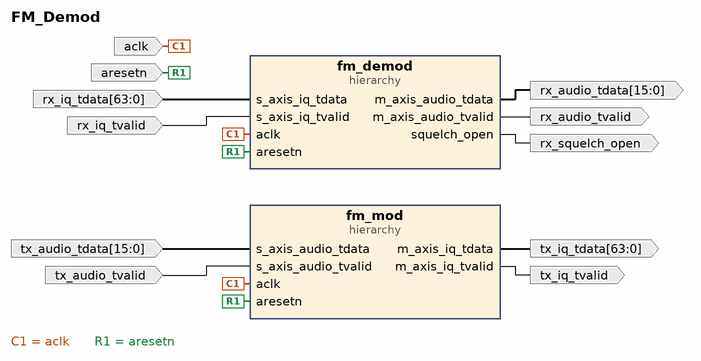
[diagram p0: block diagram of the top level]
# Vivado block design FM_Demod, xc7k410tlfbg900-2L, Vivado 2019.1
create_bd_design FM_Demod

create_bd_port -dir I -type clk aclk
set_property -dict {CONFIG.ASSOCIATED_RESET aresetn CONFIG.FREQ_HZ 100000000} [get_bd_ports aclk]
create_bd_port -dir I -type rst aresetn
set_property -dict {CONFIG.POLARITY ACTIVE_LOW} [get_bd_ports aresetn]
create_bd_port -dir I -from 63 -to 0 rx_iq_tdata
create_bd_port -dir I rx_iq_tvalid
create_bd_port -dir O -from 15 -to 0 rx_audio_tdata
create_bd_port -dir O rx_audio_tvalid
create_bd_port -dir O rx_squelch_open
create_bd_port -dir I -from 15 -to 0 tx_audio_tdata
create_bd_port -dir I tx_audio_tvalid
create_bd_port -dir O -from 63 -to 0 tx_iq_tdata
create_bd_port -dir O tx_iq_tvalid

create_bd_cell -type hier fm_demod
create_bd_cell -type hier fm_mod

# ---- hierarchy /fm_demod ----
current_bd_instance /fm_demod
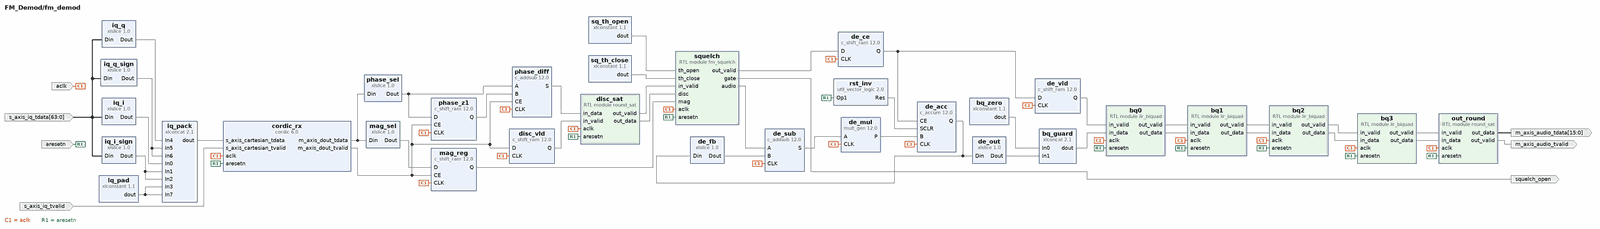
[diagram p1: block diagram inside /fm_demod, whole]
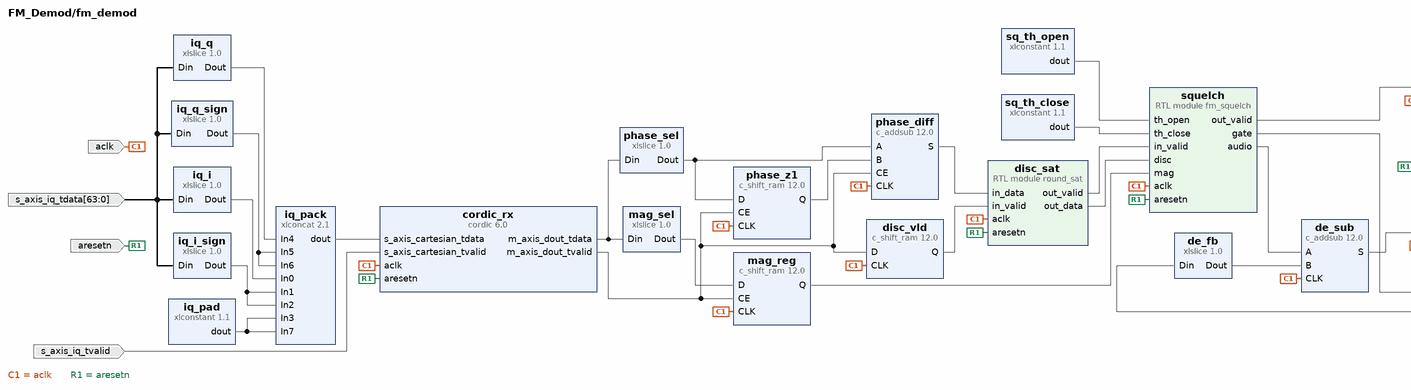
[diagram p2: block diagram inside /fm_demod, left part]
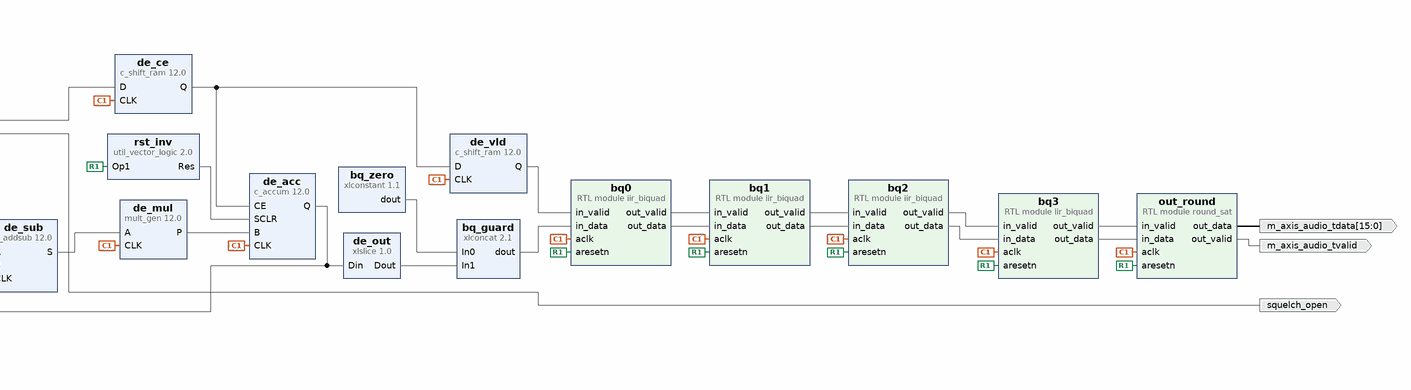
[diagram p3: block diagram inside /fm_demod, right part]
create_bd_pin -dir I -type clk aclk
create_bd_pin -dir I -type rst aresetn
create_bd_pin -dir I -from 63 -to 0 s_axis_iq_tdata
create_bd_pin -dir I s_axis_iq_tvalid
create_bd_pin -dir O -from 15 -to 0 m_axis_audio_tdata
create_bd_pin -dir O m_axis_audio_tvalid
create_bd_pin -dir O squelch_open

create_bd_cell -type ip -vlnv xilinx.com:ip:util_vector_logic:2.0 rst_inv
set_property -dict {CONFIG.C_OPERATION not CONFIG.C_SIZE 1} [get_bd_cells rst_inv]
create_bd_cell -type ip -vlnv xilinx.com:ip:xlslice:1.0 iq_i
set_property -dict {CONFIG.DIN_FROM 31 CONFIG.DIN_TO 0 CONFIG.DIN_WIDTH 64 CONFIG.DOUT_WIDTH 32} [get_bd_cells iq_i]
create_bd_cell -type ip -vlnv xilinx.com:ip:xlslice:1.0 iq_i_sign
set_property -dict {CONFIG.DIN_FROM 31 CONFIG.DIN_TO 31 CONFIG.DIN_WIDTH 64 CONFIG.DOUT_WIDTH 1} [get_bd_cells iq_i_sign]
create_bd_cell -type ip -vlnv xilinx.com:ip:xlslice:1.0 iq_q
set_property -dict {CONFIG.DIN_FROM 63 CONFIG.DIN_TO 32 CONFIG.DIN_WIDTH 64 CONFIG.DOUT_WIDTH 32} [get_bd_cells iq_q]
create_bd_cell -type ip -vlnv xilinx.com:ip:xlslice:1.0 iq_q_sign
set_property -dict {CONFIG.DIN_FROM 63 CONFIG.DIN_TO 63 CONFIG.DIN_WIDTH 64 CONFIG.DOUT_WIDTH 1} [get_bd_cells iq_q_sign]
create_bd_cell -type ip -vlnv xilinx.com:ip:xlconstant:1.1 iq_pad
set_property -dict {CONFIG.CONST_VAL 0 CONFIG.CONST_WIDTH 6} [get_bd_cells iq_pad]
create_bd_cell -type ip -vlnv xilinx.com:ip:xlconcat:2.1 iq_pack
set_property -dict [list \
  CONFIG.IN0_WIDTH 32 \
  CONFIG.IN1_WIDTH 1 \
  CONFIG.IN2_WIDTH 1 \
  CONFIG.IN3_WIDTH 6 \
  CONFIG.IN4_WIDTH 32 \
  CONFIG.IN5_WIDTH 1 \
  CONFIG.IN6_WIDTH 1 \
  CONFIG.IN7_WIDTH 6 \
  CONFIG.NUM_PORTS 8 \
] [get_bd_cells iq_pack]
create_bd_cell -type ip -vlnv xilinx.com:ip:cordic:6.0 cordic_rx
set_property -dict [list \
  CONFIG.ARESETN true \
  CONFIG.Architectural_Configuration Word_Serial \
  CONFIG.Coarse_Rotation true \
  CONFIG.Compensation_Scaling No_Scale_Compensation \
  CONFIG.Data_Format SignedFraction \
  CONFIG.Functional_Selection Translate \
  CONFIG.Input_Width 34 \
  CONFIG.Iterations 0 \
  CONFIG.Output_Width 38 \
  CONFIG.Phase_Format Scaled_Radians \
  CONFIG.Pipelining_Mode Maximum \
  CONFIG.Precision 0 \
  CONFIG.Round_Mode Truncate \
  CONFIG.flow_control NonBlocking \
] [get_bd_cells cordic_rx]
create_bd_cell -type ip -vlnv xilinx.com:ip:xlslice:1.0 mag_sel
set_property -dict {CONFIG.DIN_FROM 37 CONFIG.DIN_TO 4 CONFIG.DIN_WIDTH 80 CONFIG.DOUT_WIDTH 34} [get_bd_cells mag_sel]
create_bd_cell -type ip -vlnv xilinx.com:ip:xlslice:1.0 phase_sel
set_property -dict {CONFIG.DIN_FROM 75 CONFIG.DIN_TO 56 CONFIG.DIN_WIDTH 80 CONFIG.DOUT_WIDTH 20} [get_bd_cells phase_sel]
create_bd_cell -type ip -vlnv xilinx.com:ip:c_shift_ram:12.0 phase_z1
set_property -dict {CONFIG.CE true CONFIG.Depth 1 CONFIG.Width 20} [get_bd_cells phase_z1]
create_bd_cell -type ip -vlnv xilinx.com:ip:c_shift_ram:12.0 mag_reg
set_property -dict {CONFIG.CE true CONFIG.Depth 1 CONFIG.Width 34} [get_bd_cells mag_reg]
create_bd_cell -type ip -vlnv xilinx.com:ip:c_addsub:12.0 phase_diff
set_property -dict [list \
  CONFIG.A_Width 20 \
  CONFIG.Add_Mode Subtract \
  CONFIG.B_Width 20 \
  CONFIG.CE true \
  CONFIG.Latency 1 \
  CONFIG.Out_Width 20 \
] [get_bd_cells phase_diff]
create_bd_cell -type ip -vlnv xilinx.com:ip:c_shift_ram:12.0 disc_vld
set_property -dict {CONFIG.CE false CONFIG.Depth 1 CONFIG.Width 1} [get_bd_cells disc_vld]
create_bd_cell -type module -reference round_sat disc_sat
set_property -dict {CONFIG.IN_W 20 CONFIG.LIMIT 0 CONFIG.OUT_W 16 CONFIG.ROUND 0 CONFIG.SHIFT 2} [get_bd_cells disc_sat]
create_bd_cell -type module -reference fm_squelch squelch
set_property -dict {CONFIG.AUDIO_W 16 CONFIG.AVG_LOG2 8 CONFIG.MAG_W 34} [get_bd_cells squelch]
create_bd_cell -type ip -vlnv xilinx.com:ip:xlconstant:1.1 sq_th_open
set_property -dict {CONFIG.CONST_VAL 312575733 CONFIG.CONST_WIDTH 34} [get_bd_cells sq_th_open]
create_bd_cell -type ip -vlnv xilinx.com:ip:xlconstant:1.1 sq_th_close
set_property -dict {CONFIG.CONST_VAL 156287866 CONFIG.CONST_WIDTH 34} [get_bd_cells sq_th_close]
create_bd_cell -type ip -vlnv xilinx.com:ip:c_addsub:12.0 de_sub
set_property -dict [list \
  CONFIG.A_Width 16 \
  CONFIG.Add_Mode Subtract \
  CONFIG.B_Width 16 \
  CONFIG.CE false \
  CONFIG.Latency 1 \
  CONFIG.Out_Width 17 \
] [get_bd_cells de_sub]
create_bd_cell -type ip -vlnv xilinx.com:ip:mult_gen:12.0 de_mul
set_property -dict [list \
  CONFIG.ConstValue 1795 \
  CONFIG.MultType Constant_Coefficient_Multiplier \
  CONFIG.PipeStages 1 \
  CONFIG.PortAType Signed \
  CONFIG.PortAWidth 17 \
] [get_bd_cells de_mul]
create_bd_cell -type ip -vlnv xilinx.com:ip:c_accum:12.0 de_acc
set_property -dict [list \
  CONFIG.Accum_Mode Add \
  CONFIG.Bypass false \
  CONFIG.CE true \
  CONFIG.Input_Type Signed \
  CONFIG.Input_Width 28 \
  CONFIG.Latency 1 \
  CONFIG.Output_Width 32 \
  CONFIG.SCLR true \
] [get_bd_cells de_acc]
create_bd_cell -type ip -vlnv xilinx.com:ip:xlslice:1.0 de_fb
set_property -dict {CONFIG.DIN_FROM 31 CONFIG.DIN_TO 16 CONFIG.DIN_WIDTH 32 CONFIG.DOUT_WIDTH 16} [get_bd_cells de_fb]
create_bd_cell -type ip -vlnv xilinx.com:ip:xlslice:1.0 de_out
set_property -dict {CONFIG.DIN_FROM 31 CONFIG.DIN_TO 14 CONFIG.DIN_WIDTH 32 CONFIG.DOUT_WIDTH 18} [get_bd_cells de_out]
create_bd_cell -type ip -vlnv xilinx.com:ip:c_shift_ram:12.0 de_ce
set_property -dict {CONFIG.CE false CONFIG.Depth 4 CONFIG.Width 1} [get_bd_cells de_ce]
create_bd_cell -type ip -vlnv xilinx.com:ip:c_shift_ram:12.0 de_vld
set_property -dict {CONFIG.CE false CONFIG.Depth 1 CONFIG.Width 1} [get_bd_cells de_vld]
create_bd_cell -type ip -vlnv xilinx.com:ip:xlconstant:1.1 bq_zero
set_property -dict {CONFIG.CONST_VAL 0 CONFIG.CONST_WIDTH 8} [get_bd_cells bq_zero]
create_bd_cell -type ip -vlnv xilinx.com:ip:xlconcat:2.1 bq_guard
set_property -dict {CONFIG.IN0_WIDTH 8 CONFIG.IN1_WIDTH 18 CONFIG.NUM_PORTS 2} [get_bd_cells bq_guard]
create_bd_cell -type module -reference iir_biquad bq0
set_property -dict [list \
  CONFIG.A1 -126387 \
  CONFIG.A2 60948 \
  CONFIG.B0 63218 \
  CONFIG.B1 -126436 \
  CONFIG.B2 63218 \
  CONFIG.COEF_W 18 \
  CONFIG.DATA_W 26 \
  CONFIG.FRAC 16 \
] [get_bd_cells bq0]
create_bd_cell -type module -reference iir_biquad bq1
set_property -dict [list \
  CONFIG.A1 -129032 \
  CONFIG.A2 63596 \
  CONFIG.B0 64541 \
  CONFIG.B1 -129082 \
  CONFIG.B2 64541 \
  CONFIG.COEF_W 18 \
  CONFIG.DATA_W 26 \
  CONFIG.FRAC 16 \
] [get_bd_cells bq1]
create_bd_cell -type module -reference iir_biquad bq2
set_property -dict [list \
  CONFIG.A1 -89464 \
  CONFIG.A2 31299 \
  CONFIG.B0 1843 \
  CONFIG.B1 3686 \
  CONFIG.B2 1843 \
  CONFIG.COEF_W 18 \
  CONFIG.DATA_W 26 \
  CONFIG.FRAC 16 \
] [get_bd_cells bq2]
create_bd_cell -type module -reference iir_biquad bq3
set_property -dict [list \
  CONFIG.A1 -105626 \
  CONFIG.A2 48793 \
  CONFIG.B0 2176 \
  CONFIG.B1 4352 \
  CONFIG.B2 2176 \
  CONFIG.COEF_W 18 \
  CONFIG.DATA_W 26 \
  CONFIG.FRAC 16 \
] [get_bd_cells bq3]
create_bd_cell -type module -reference round_sat out_round
set_property -dict {CONFIG.IN_W 26 CONFIG.LIMIT 0 CONFIG.OUT_W 16 CONFIG.ROUND 1 CONFIG.SHIFT 8} [get_bd_cells out_round]

# ---- hierarchy /fm_mod ----
current_bd_instance /fm_mod
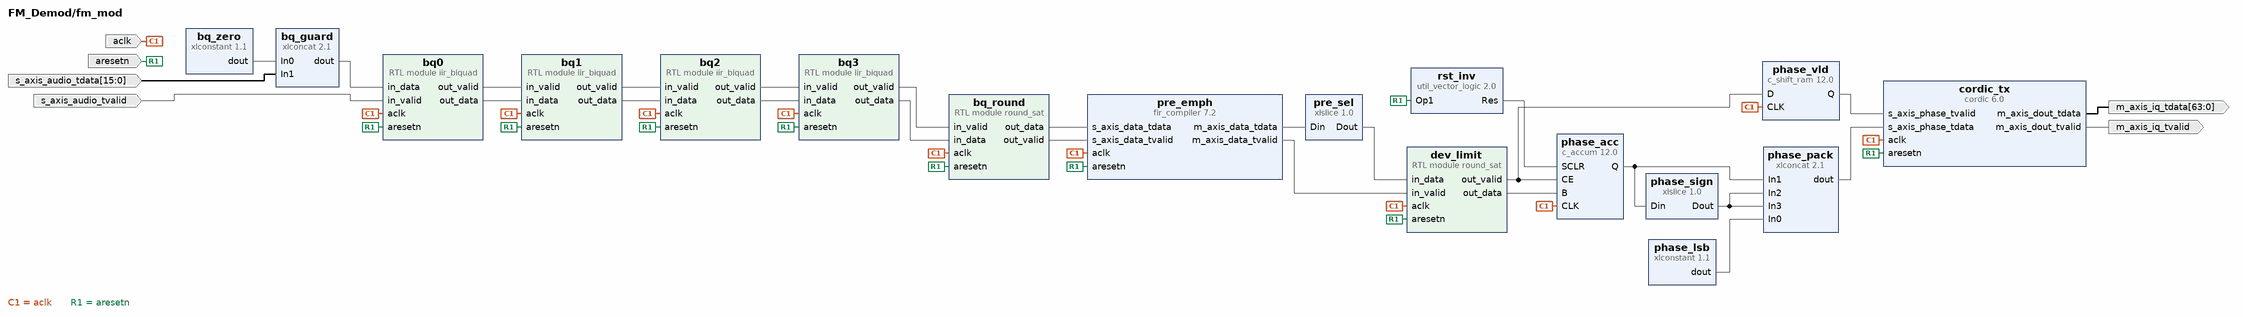
[diagram p4: block diagram inside /fm_mod]
create_bd_pin -dir I -type clk aclk
create_bd_pin -dir I -type rst aresetn
create_bd_pin -dir I -from 15 -to 0 s_axis_audio_tdata
create_bd_pin -dir I s_axis_audio_tvalid
create_bd_pin -dir O -from 63 -to 0 m_axis_iq_tdata
create_bd_pin -dir O m_axis_iq_tvalid

create_bd_cell -type ip -vlnv xilinx.com:ip:util_vector_logic:2.0 rst_inv
set_property -dict {CONFIG.C_OPERATION not CONFIG.C_SIZE 1} [get_bd_cells rst_inv]
create_bd_cell -type ip -vlnv xilinx.com:ip:xlconstant:1.1 bq_zero
set_property -dict {CONFIG.CONST_VAL 0 CONFIG.CONST_WIDTH 8} [get_bd_cells bq_zero]
create_bd_cell -type ip -vlnv xilinx.com:ip:xlconcat:2.1 bq_guard
set_property -dict {CONFIG.IN0_WIDTH 8 CONFIG.IN1_WIDTH 16 CONFIG.NUM_PORTS 2} [get_bd_cells bq_guard]
create_bd_cell -type module -reference iir_biquad bq0
set_property -dict [list \
  CONFIG.A1 -126387 \
  CONFIG.A2 60948 \
  CONFIG.B0 63218 \
  CONFIG.B1 -126436 \
  CONFIG.B2 63218 \
  CONFIG.COEF_W 18 \
  CONFIG.DATA_W 24 \
  CONFIG.FRAC 16 \
] [get_bd_cells bq0]
create_bd_cell -type module -reference iir_biquad bq1
set_property -dict [list \
  CONFIG.A1 -129032 \
  CONFIG.A2 63596 \
  CONFIG.B0 64541 \
  CONFIG.B1 -129082 \
  CONFIG.B2 64541 \
  CONFIG.COEF_W 18 \
  CONFIG.DATA_W 24 \
  CONFIG.FRAC 16 \
] [get_bd_cells bq1]
create_bd_cell -type module -reference iir_biquad bq2
set_property -dict [list \
  CONFIG.A1 -89464 \
  CONFIG.A2 31299 \
  CONFIG.B0 1843 \
  CONFIG.B1 3686 \
  CONFIG.B2 1843 \
  CONFIG.COEF_W 18 \
  CONFIG.DATA_W 24 \
  CONFIG.FRAC 16 \
] [get_bd_cells bq2]
create_bd_cell -type module -reference iir_biquad bq3
set_property -dict [list \
  CONFIG.A1 -105626 \
  CONFIG.A2 48793 \
  CONFIG.B0 2176 \
  CONFIG.B1 4352 \
  CONFIG.B2 2176 \
  CONFIG.COEF_W 18 \
  CONFIG.DATA_W 24 \
  CONFIG.FRAC 16 \
] [get_bd_cells bq3]
create_bd_cell -type module -reference round_sat bq_round
set_property -dict {CONFIG.IN_W 24 CONFIG.LIMIT 0 CONFIG.OUT_W 16 CONFIG.ROUND 1 CONFIG.SHIFT 8} [get_bd_cells bq_round]
create_bd_cell -type ip -vlnv xilinx.com:ip:fir_compiler:7.2 pre_emph
set_property -dict [list \
  CONFIG.Clock_Frequency 100.0 \
  CONFIG.CoefficientSource Vector \
  CONFIG.CoefficientVector 9347,-9091 \
  CONFIG.Coefficient_Fractional_Bits 0 \
  CONFIG.Coefficient_Sign Signed \
  CONFIG.Coefficient_Structure Non_Symmetric \
  CONFIG.Coefficient_Width 15 \
  CONFIG.Data_Fractional_Bits 0 \
  CONFIG.Data_Sign Signed \
  CONFIG.Data_Width 16 \
  CONFIG.Filter_Architecture Systolic_Multiply_Accumulate \
  CONFIG.Filter_Type Single_Rate \
  CONFIG.Has_ARESETn true \
  CONFIG.Output_Rounding_Mode Full_Precision \
  CONFIG.Quantization Integer_Coefficients \
  CONFIG.RateSpecification Frequency_Specification \
  CONFIG.S_DATA_Has_FIFO false \
  CONFIG.Sample_Frequency 0.048 \
] [get_bd_cells pre_emph]
create_bd_cell -type ip -vlnv xilinx.com:ip:xlslice:1.0 pre_sel
set_property -dict {CONFIG.DIN_FROM 30 CONFIG.DIN_TO 0 CONFIG.DIN_WIDTH 32 CONFIG.DOUT_WIDTH 31} [get_bd_cells pre_sel]
create_bd_cell -type module -reference round_sat dev_limit
set_property -dict {CONFIG.IN_W 31 CONFIG.LIMIT 13981013 CONFIG.OUT_W 25 CONFIG.ROUND 0 CONFIG.SHIFT 0} [get_bd_cells dev_limit]
create_bd_cell -type ip -vlnv xilinx.com:ip:c_accum:12.0 phase_acc
set_property -dict [list \
  CONFIG.Accum_Mode Add \
  CONFIG.Bypass false \
  CONFIG.CE true \
  CONFIG.Input_Type Signed \
  CONFIG.Input_Width 25 \
  CONFIG.Latency 1 \
  CONFIG.Output_Width 28 \
  CONFIG.SCLR true \
] [get_bd_cells phase_acc]
create_bd_cell -type ip -vlnv xilinx.com:ip:c_shift_ram:12.0 phase_vld
set_property -dict {CONFIG.CE false CONFIG.Depth 1 CONFIG.Width 1} [get_bd_cells phase_vld]
create_bd_cell -type ip -vlnv xilinx.com:ip:xlslice:1.0 phase_sign
set_property -dict {CONFIG.DIN_FROM 27 CONFIG.DIN_TO 27 CONFIG.DIN_WIDTH 28 CONFIG.DOUT_WIDTH 1} [get_bd_cells phase_sign]
create_bd_cell -type ip -vlnv xilinx.com:ip:xlconstant:1.1 phase_lsb
set_property -dict {CONFIG.CONST_VAL 0 CONFIG.CONST_WIDTH 2} [get_bd_cells phase_lsb]
create_bd_cell -type ip -vlnv xilinx.com:ip:xlconcat:2.1 phase_pack
set_property -dict [list \
  CONFIG.IN0_WIDTH 2 \
  CONFIG.IN1_WIDTH 28 \
  CONFIG.IN2_WIDTH 1 \
  CONFIG.IN3_WIDTH 1 \
  CONFIG.NUM_PORTS 4 \
] [get_bd_cells phase_pack]
create_bd_cell -type ip -vlnv xilinx.com:ip:cordic:6.0 cordic_tx
set_property -dict [list \
  CONFIG.ARESETN true \
  CONFIG.Architectural_Configuration Word_Serial \
  CONFIG.Coarse_Rotation true \
  CONFIG.Data_Format SignedFraction \
  CONFIG.Functional_Selection Sin_and_Cos \
  CONFIG.Input_Width 32 \
  CONFIG.Iterations 0 \
  CONFIG.Output_Width 32 \
  CONFIG.Phase_Format Scaled_Radians \
  CONFIG.Pipelining_Mode Maximum \
  CONFIG.Precision 0 \
  CONFIG.Round_Mode Nearest_Even \
  CONFIG.flow_control NonBlocking \
] [get_bd_cells cordic_tx]

# ---- connections ----

current_bd_instance /fm_demod
connect_bd_net [get_bd_pins s_axis_iq_tdata] [get_bd_pins iq_i/Din] [get_bd_pins iq_i_sign/Din] [get_bd_pins iq_q/Din] [get_bd_pins iq_q_sign/Din]
connect_bd_net [get_bd_pins iq_i/Dout] [get_bd_pins iq_pack/In0]
connect_bd_net [get_bd_pins iq_i_sign/Dout] [get_bd_pins iq_pack/In1] [get_bd_pins iq_pack/In2]
connect_bd_net [get_bd_pins iq_q/Dout] [get_bd_pins iq_pack/In4]
connect_bd_net [get_bd_pins iq_q_sign/Dout] [get_bd_pins iq_pack/In5] [get_bd_pins iq_pack/In6]
connect_bd_net [get_bd_pins iq_pad/dout] [get_bd_pins iq_pack/In3] [get_bd_pins iq_pack/In7]
connect_bd_net [get_bd_pins iq_pack/dout] [get_bd_pins cordic_rx/s_axis_cartesian_tdata]
connect_bd_net [get_bd_pins s_axis_iq_tvalid] [get_bd_pins cordic_rx/s_axis_cartesian_tvalid]
connect_bd_net [get_bd_pins cordic_rx/m_axis_dout_tdata] [get_bd_pins mag_sel/Din] [get_bd_pins phase_sel/Din]
connect_bd_net [get_bd_pins phase_sel/Dout] [get_bd_pins phase_z1/D] [get_bd_pins phase_diff/A]
connect_bd_net [get_bd_pins phase_z1/Q] [get_bd_pins phase_diff/B]
connect_bd_net [get_bd_pins mag_sel/Dout] [get_bd_pins mag_reg/D]
connect_bd_net [get_bd_pins cordic_rx/m_axis_dout_tvalid] \
  [get_bd_pins phase_z1/CE] [get_bd_pins mag_reg/CE] [get_bd_pins phase_diff/CE] [get_bd_pins disc_vld/D]
connect_bd_net [get_bd_pins phase_diff/S] [get_bd_pins disc_sat/in_data]
connect_bd_net [get_bd_pins disc_vld/Q] [get_bd_pins disc_sat/in_valid]
connect_bd_net [get_bd_pins disc_sat/out_valid] [get_bd_pins squelch/in_valid]
connect_bd_net [get_bd_pins disc_sat/out_data] [get_bd_pins squelch/disc]
connect_bd_net [get_bd_pins mag_reg/Q] [get_bd_pins squelch/mag]
connect_bd_net [get_bd_pins sq_th_open/dout] [get_bd_pins squelch/th_open]
connect_bd_net [get_bd_pins sq_th_close/dout] [get_bd_pins squelch/th_close]
connect_bd_net [get_bd_pins squelch/gate] [get_bd_pins squelch_open]
connect_bd_net [get_bd_pins squelch/audio] [get_bd_pins de_sub/A]
connect_bd_net [get_bd_pins de_fb/Dout] [get_bd_pins de_sub/B]
connect_bd_net [get_bd_pins de_sub/S] [get_bd_pins de_mul/A]
connect_bd_net [get_bd_pins de_mul/P] [get_bd_pins de_acc/B]
connect_bd_net [get_bd_pins de_acc/Q] [get_bd_pins de_fb/Din] [get_bd_pins de_out/Din]
connect_bd_net [get_bd_pins squelch/out_valid] [get_bd_pins de_ce/D]
connect_bd_net [get_bd_pins de_ce/Q] [get_bd_pins de_acc/CE] [get_bd_pins de_vld/D]
connect_bd_net [get_bd_pins bq_zero/dout] [get_bd_pins bq_guard/In0]
connect_bd_net [get_bd_pins de_out/Dout] [get_bd_pins bq_guard/In1]
connect_bd_net [get_bd_pins de_vld/Q] [get_bd_pins bq0/in_valid]
connect_bd_net [get_bd_pins bq_guard/dout] [get_bd_pins bq0/in_data]
connect_bd_net [get_bd_pins bq0/out_valid] [get_bd_pins bq1/in_valid]
connect_bd_net [get_bd_pins bq0/out_data] [get_bd_pins bq1/in_data]
connect_bd_net [get_bd_pins bq1/out_valid] [get_bd_pins bq2/in_valid]
connect_bd_net [get_bd_pins bq1/out_data] [get_bd_pins bq2/in_data]
connect_bd_net [get_bd_pins bq2/out_valid] [get_bd_pins bq3/in_valid]
connect_bd_net [get_bd_pins bq2/out_data] [get_bd_pins bq3/in_data]
connect_bd_net [get_bd_pins bq3/out_valid] [get_bd_pins out_round/in_valid]
connect_bd_net [get_bd_pins bq3/out_data] [get_bd_pins out_round/in_data]
connect_bd_net [get_bd_pins out_round/out_data] [get_bd_pins m_axis_audio_tdata]
connect_bd_net [get_bd_pins out_round/out_valid] [get_bd_pins m_axis_audio_tvalid]
connect_bd_net [get_bd_pins aclk] \
  [get_bd_pins bq0/aclk] [get_bd_pins bq1/aclk] [get_bd_pins bq2/aclk] [get_bd_pins bq3/aclk] [get_bd_pins cordic_rx/aclk] \
  [get_bd_pins de_acc/CLK] [get_bd_pins de_ce/CLK] [get_bd_pins de_mul/CLK] [get_bd_pins de_sub/CLK] [get_bd_pins de_vld/CLK] \
  [get_bd_pins disc_sat/aclk] [get_bd_pins disc_vld/CLK] [get_bd_pins mag_reg/CLK] [get_bd_pins out_round/aclk] \
  [get_bd_pins phase_diff/CLK] [get_bd_pins phase_z1/CLK] [get_bd_pins squelch/aclk]
connect_bd_net [get_bd_pins aresetn] \
  [get_bd_pins bq0/aresetn] [get_bd_pins bq1/aresetn] [get_bd_pins bq2/aresetn] [get_bd_pins bq3/aresetn] \
  [get_bd_pins cordic_rx/aresetn] [get_bd_pins disc_sat/aresetn] [get_bd_pins out_round/aresetn] \
  [get_bd_pins squelch/aresetn] [get_bd_pins rst_inv/Op1]
connect_bd_net [get_bd_pins rst_inv/Res] [get_bd_pins de_acc/SCLR]

current_bd_instance /fm_mod
connect_bd_net [get_bd_pins bq_zero/dout] [get_bd_pins bq_guard/In0]
connect_bd_net [get_bd_pins s_axis_audio_tdata] [get_bd_pins bq_guard/In1]
connect_bd_net [get_bd_pins s_axis_audio_tvalid] [get_bd_pins bq0/in_valid]
connect_bd_net [get_bd_pins bq_guard/dout] [get_bd_pins bq0/in_data]
connect_bd_net [get_bd_pins bq0/out_valid] [get_bd_pins bq1/in_valid]
connect_bd_net [get_bd_pins bq0/out_data] [get_bd_pins bq1/in_data]
connect_bd_net [get_bd_pins bq1/out_valid] [get_bd_pins bq2/in_valid]
connect_bd_net [get_bd_pins bq1/out_data] [get_bd_pins bq2/in_data]
connect_bd_net [get_bd_pins bq2/out_valid] [get_bd_pins bq3/in_valid]
connect_bd_net [get_bd_pins bq2/out_data] [get_bd_pins bq3/in_data]
connect_bd_net [get_bd_pins bq3/out_valid] [get_bd_pins bq_round/in_valid]
connect_bd_net [get_bd_pins bq3/out_data] [get_bd_pins bq_round/in_data]
connect_bd_net [get_bd_pins bq_round/out_data] [get_bd_pins pre_emph/s_axis_data_tdata]
connect_bd_net [get_bd_pins bq_round/out_valid] [get_bd_pins pre_emph/s_axis_data_tvalid]
connect_bd_net [get_bd_pins pre_emph/m_axis_data_tdata] [get_bd_pins pre_sel/Din]
connect_bd_net [get_bd_pins pre_sel/Dout] [get_bd_pins dev_limit/in_data]
connect_bd_net [get_bd_pins pre_emph/m_axis_data_tvalid] [get_bd_pins dev_limit/in_valid]
connect_bd_net [get_bd_pins dev_limit/out_data] [get_bd_pins phase_acc/B]
connect_bd_net [get_bd_pins dev_limit/out_valid] [get_bd_pins phase_acc/CE] [get_bd_pins phase_vld/D]
connect_bd_net [get_bd_pins phase_acc/Q] [get_bd_pins phase_sign/Din] [get_bd_pins phase_pack/In1]
connect_bd_net [get_bd_pins phase_lsb/dout] [get_bd_pins phase_pack/In0]
connect_bd_net [get_bd_pins phase_sign/Dout] [get_bd_pins phase_pack/In2] [get_bd_pins phase_pack/In3]
connect_bd_net [get_bd_pins phase_pack/dout] [get_bd_pins cordic_tx/s_axis_phase_tdata]
connect_bd_net [get_bd_pins phase_vld/Q] [get_bd_pins cordic_tx/s_axis_phase_tvalid]
connect_bd_net [get_bd_pins cordic_tx/m_axis_dout_tdata] [get_bd_pins m_axis_iq_tdata]
connect_bd_net [get_bd_pins cordic_tx/m_axis_dout_tvalid] [get_bd_pins m_axis_iq_tvalid]
connect_bd_net [get_bd_pins aclk] \
  [get_bd_pins bq0/aclk] [get_bd_pins bq1/aclk] [get_bd_pins bq2/aclk] [get_bd_pins bq3/aclk] [get_bd_pins bq_round/aclk] \
  [get_bd_pins cordic_tx/aclk] [get_bd_pins dev_limit/aclk] [get_bd_pins phase_acc/CLK] [get_bd_pins phase_vld/CLK] \
  [get_bd_pins pre_emph/aclk]
connect_bd_net [get_bd_pins aresetn] \
  [get_bd_pins bq0/aresetn] [get_bd_pins bq1/aresetn] [get_bd_pins bq2/aresetn] [get_bd_pins bq3/aresetn] \
  [get_bd_pins bq_round/aresetn] [get_bd_pins cordic_tx/aresetn] [get_bd_pins dev_limit/aresetn] \
  [get_bd_pins pre_emph/aresetn] [get_bd_pins rst_inv/Op1]
connect_bd_net [get_bd_pins rst_inv/Res] [get_bd_pins phase_acc/SCLR]

current_bd_instance /
connect_bd_net [get_bd_ports aclk] [get_bd_pins fm_demod/aclk] [get_bd_pins fm_mod/aclk]
connect_bd_net [get_bd_ports aresetn] [get_bd_pins fm_demod/aresetn] [get_bd_pins fm_mod/aresetn]
connect_bd_net [get_bd_ports rx_iq_tdata] [get_bd_pins fm_demod/s_axis_iq_tdata]
connect_bd_net [get_bd_ports rx_iq_tvalid] [get_bd_pins fm_demod/s_axis_iq_tvalid]
connect_bd_net [get_bd_pins fm_demod/m_axis_audio_tdata] [get_bd_ports rx_audio_tdata]
connect_bd_net [get_bd_pins fm_demod/m_axis_audio_tvalid] [get_bd_ports rx_audio_tvalid]
connect_bd_net [get_bd_pins fm_demod/squelch_open] [get_bd_ports rx_squelch_open]
connect_bd_net [get_bd_ports tx_audio_tdata] [get_bd_pins fm_mod/s_axis_audio_tdata]
connect_bd_net [get_bd_ports tx_audio_tvalid] [get_bd_pins fm_mod/s_axis_audio_tvalid]
connect_bd_net [get_bd_pins fm_mod/m_axis_iq_tdata] [get_bd_ports tx_iq_tdata]
connect_bd_net [get_bd_pins fm_mod/m_axis_iq_tvalid] [get_bd_ports tx_iq_tvalid]

validate_bd_design
save_bd_design
